# Altium schematic sheet 02-Clock.SchDoc: Clock
size A4; Organization: ORGANIZATION; Address1: ADDRESS 1; Address2: ADDRESS 2; Address3: ADDRESS 3; Address4: ADDRESS 4; SheetNumber: 2; SheetTotal: 7; ENG_APP_DATE: --/--/--; DSN_APP_DATE: --/--/--; CHK_APP_DATE: --/--/--
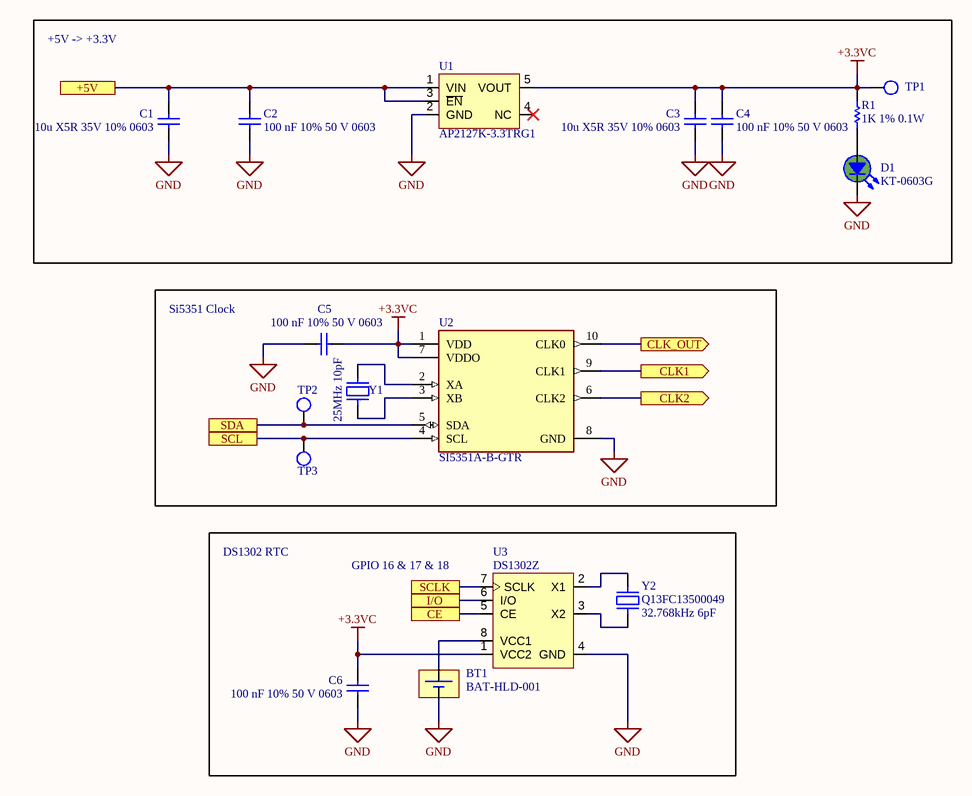
[diagram p0: 02-Clock.SchDoc]

## Parts
BT1  BAT-HLD-001  [BATHLD-001]
C1  10u X5R 35V 10% 0603  [C0603]
C2  100 nF 10% 50 V 0603  [CAPC1608X90X40NL10T20]
C3  10u X5R 35V 10% 0603  [C0603]
C4  100 nF 10% 50 V 0603  [CAPC1608X90X40NL10T20]
C5  100 nF 10% 50 V 0603  [CAPC1608X90X40NL10T20]
C6  100 nF 10% 50 V 0603  [CAPC1608X90X40NL10T20]
D1  KT-0603G  [LED-0603-RED]
R1  1K 1% 0.1W  [R0603]
TP1  Touchpoint  [Touchpoint-Footprint-1]  (value not drawn)  (no BOM)
TP2  Touchpoint  [Touchpoint-Footprint-1]  (value not drawn)  (no BOM)
TP3  Touchpoint  [Touchpoint-Footprint-1]  (value not drawn)  (no BOM)
U1  AP2127K-3.3TRG1  [FP-SOT25-IPC_B]
U2  SI5351A-B-GTR  [FP-SI5351A-B-GTR-IPC_B]
U3  DS1302Z  [SO8]
Y1  value 25MHz 10pF  [X50328MSB2GI-Footprint-1]  (hidden comment: XG1EL89CKI-111YLC-25M)
Y2  Q13FC13500049  value 32.768kHz 6pF  [FP-ABS07-120-MFG]

## Blocks framed on the sheet
+5V -> +3.3V: C1-C4 D1 R1 TP1 U1
Si5351 Clock: C5 TP2 TP3 U2 Y1

## Ports
+5V, CE, CLK1 (out), CLK2 (out), CLK_OUT (out), I/O, SCL, SCLK, SDA

## Nets
+3.3VC: C3.2 C4.2 C5.1 C6.1 R1.1 TP1.0 U1.5(VOUT) U2.1(VDD) U2.7(VDDO) U3.1(VCC2)
GND: BT1.1(-) C1.1 C2.1 C3.1 C4.1 C5.2 C6.2 D1.2 U1.2(GND) U2.8(GND) U3.4(GND)
+5V: C1.2 C2.2 U1.1(VIN) U1.3(~{EN}) ; port +5V
CE: U3.5(CE) ; port CE
CLK1: U2.9(CLK1) ; port CLK1
CLK2: U2.6(CLK2) ; port CLK2
CLK_OUT: U2.10(CLK0) ; port CLK_OUT
I/O: U3.6(I/O) ; port I/O
SCL: TP3.0 U2.4(SCL) ; port SCL
SCLK: U3.7(SCLK) ; port SCLK
SDA: TP2.0 U2.5(SDA) ; port SDA
NetBT1_2: BT1.2(+) U3.8(VCC1)
NetD1_1: D1.1 R1.2
NetU2_2: U2.2(XA) Y1.2
NetU2_3: U2.3(XB) Y1.1
NetU3_2: U3.2(X1) Y2.2
NetU3_3: U3.3(X2) Y2.1

Not connected (* = marked no-connect by the designer): U1 4(NC)*

## Notes on the sheet
- DS1302 RTC
- (near U3) GPIO 16 & 17 & 18
- Revision
- Project
- Author
- Page Title

## Library data of the parts
BT1 = CMP-002-00120-1: CR2032 Phosphor Bronze / Nickel Plated 20 mm Cell Size Battery Holder; MFR: TE Connectivity; LCSC_Price_1ku: 0.4659; MFR_Part_#: BAT-HLD-001; LCSC_Part_#: C7501066
C1 C3 = CMP-001-00153-3: MLCC 10u X5R 35V 10% 0603; MFR_Part_#: GRM188R6YA106MA73D; Manufacturer: Generic; Dielectric: X7R; Component Type: Standard; PartNumber: 10u X5R 35V 10% 0603; Value: 10u; LCSC_Part_#: C194427; Tolerance: 10%; Pin Count: 2; Status: Preferred; Source: GT_WH_Control.SCHLIB; Voltage: 35V; LCSC_Price_1ku: 0.0213; Design Item ID: 10u X5R 35V 10% 0603
C2 C4-C6 = CMP-001-00017-8: Chip Capacitor, 100 nF, +/- 10%, 50 V, 0603 (1608 Metric); MFR_Part_#: CC0603KRX7R9BB104; Voltage Rating: 50V; Value: 100nF; Capacitor Type: Ceramic; Mounting Technology: SM; LCSC_Price_1ku: 0.0015; Pins: 2; RoHS Compliant: True; LCSC_Part_#: C14663; Max Operating Temperature: 125°C; Tolerance: 10%; Case/Package: 0603; Min Operating Temperature: -55°C
D1 = CMP-007-00044-3: 0603 Green LED; MFR_Part_#: KT-0603G; LCSC_Price_1ku: 0.0068; LCSC_Part_#: C12624
R1 = CMP-009-00312-2: Standard Resistor 1K 1% 0.1W 0603; MFR_Part_#: 0603WAF1001T5E; Manufacturer: Generic; TC: 200; Tolerance: 1%; LCSC_Part_#: C21190; Value: 1K; LCSC_Price_1ku: 0.0007; Power: 0.1W; Pin Count: 2; PartNumber: 1K 1% 0.1W 0603; Design Item ID: 1K 1% 0.1W 0603; Component Type: Standard; Source: GT_WH_Control.SCHLIB
TP1-TP3 = CMP-001-0002-2: 60mils touchpoint
U1 = CMP-019-00060-1: IC REG LDO 3.3V 0.3A SOT23-5; MFR: Diodes Incorporated; LCSC_Price_1ku: 0.0388; LCSC_Part_#: C156285; MFR_Part_#: AP2127K-3.3TRG1
U2 = CMP-003-00032-1: IC CLK GENERATOR 160MHZ 10MSOP; MFR_Part_#: SKYWORKS/SILICON LABS; LCSC_Part_#: C504891; MFR: SI5351A-B-GTR; LCSC_Price_1ku: 0.5946
U3 = CMP-023-00001-2: Three-Wire Serial Interface SOP-8 Real Time Clocks ROHS; MFR: JSMSEMI; LCSC_Price_1ku: 0.1005; MFR_Part_#: DS1302Z; LCSC_Part_#: C2900599
Y1 = CMP-003-00033-1: 25MHz Surface Mount Crystal 8pF ±10ppm ±20ppm SMD5032 Crystals ROHS; Manufacturer: YXC; LCSC_Price_1ku: 0.1118; LCSC_Part_#: C19711738; MFR_Part_#: XG1EL89CKI-111YLC-25M
Y2 = CMP-003-00034-2: 32.768kHz Surface Mount Crystal 6pF ±20ppm SMD3215-2P Crystals ROHS; MFR: Seiko Epson; MFR_Part_#: Q13FC13500049; LCSC_Price_1ku: 0.1269; LCSC_Part_#: C95361